# EasyEDA Pro project C8T6v1.eprj, board PCB5
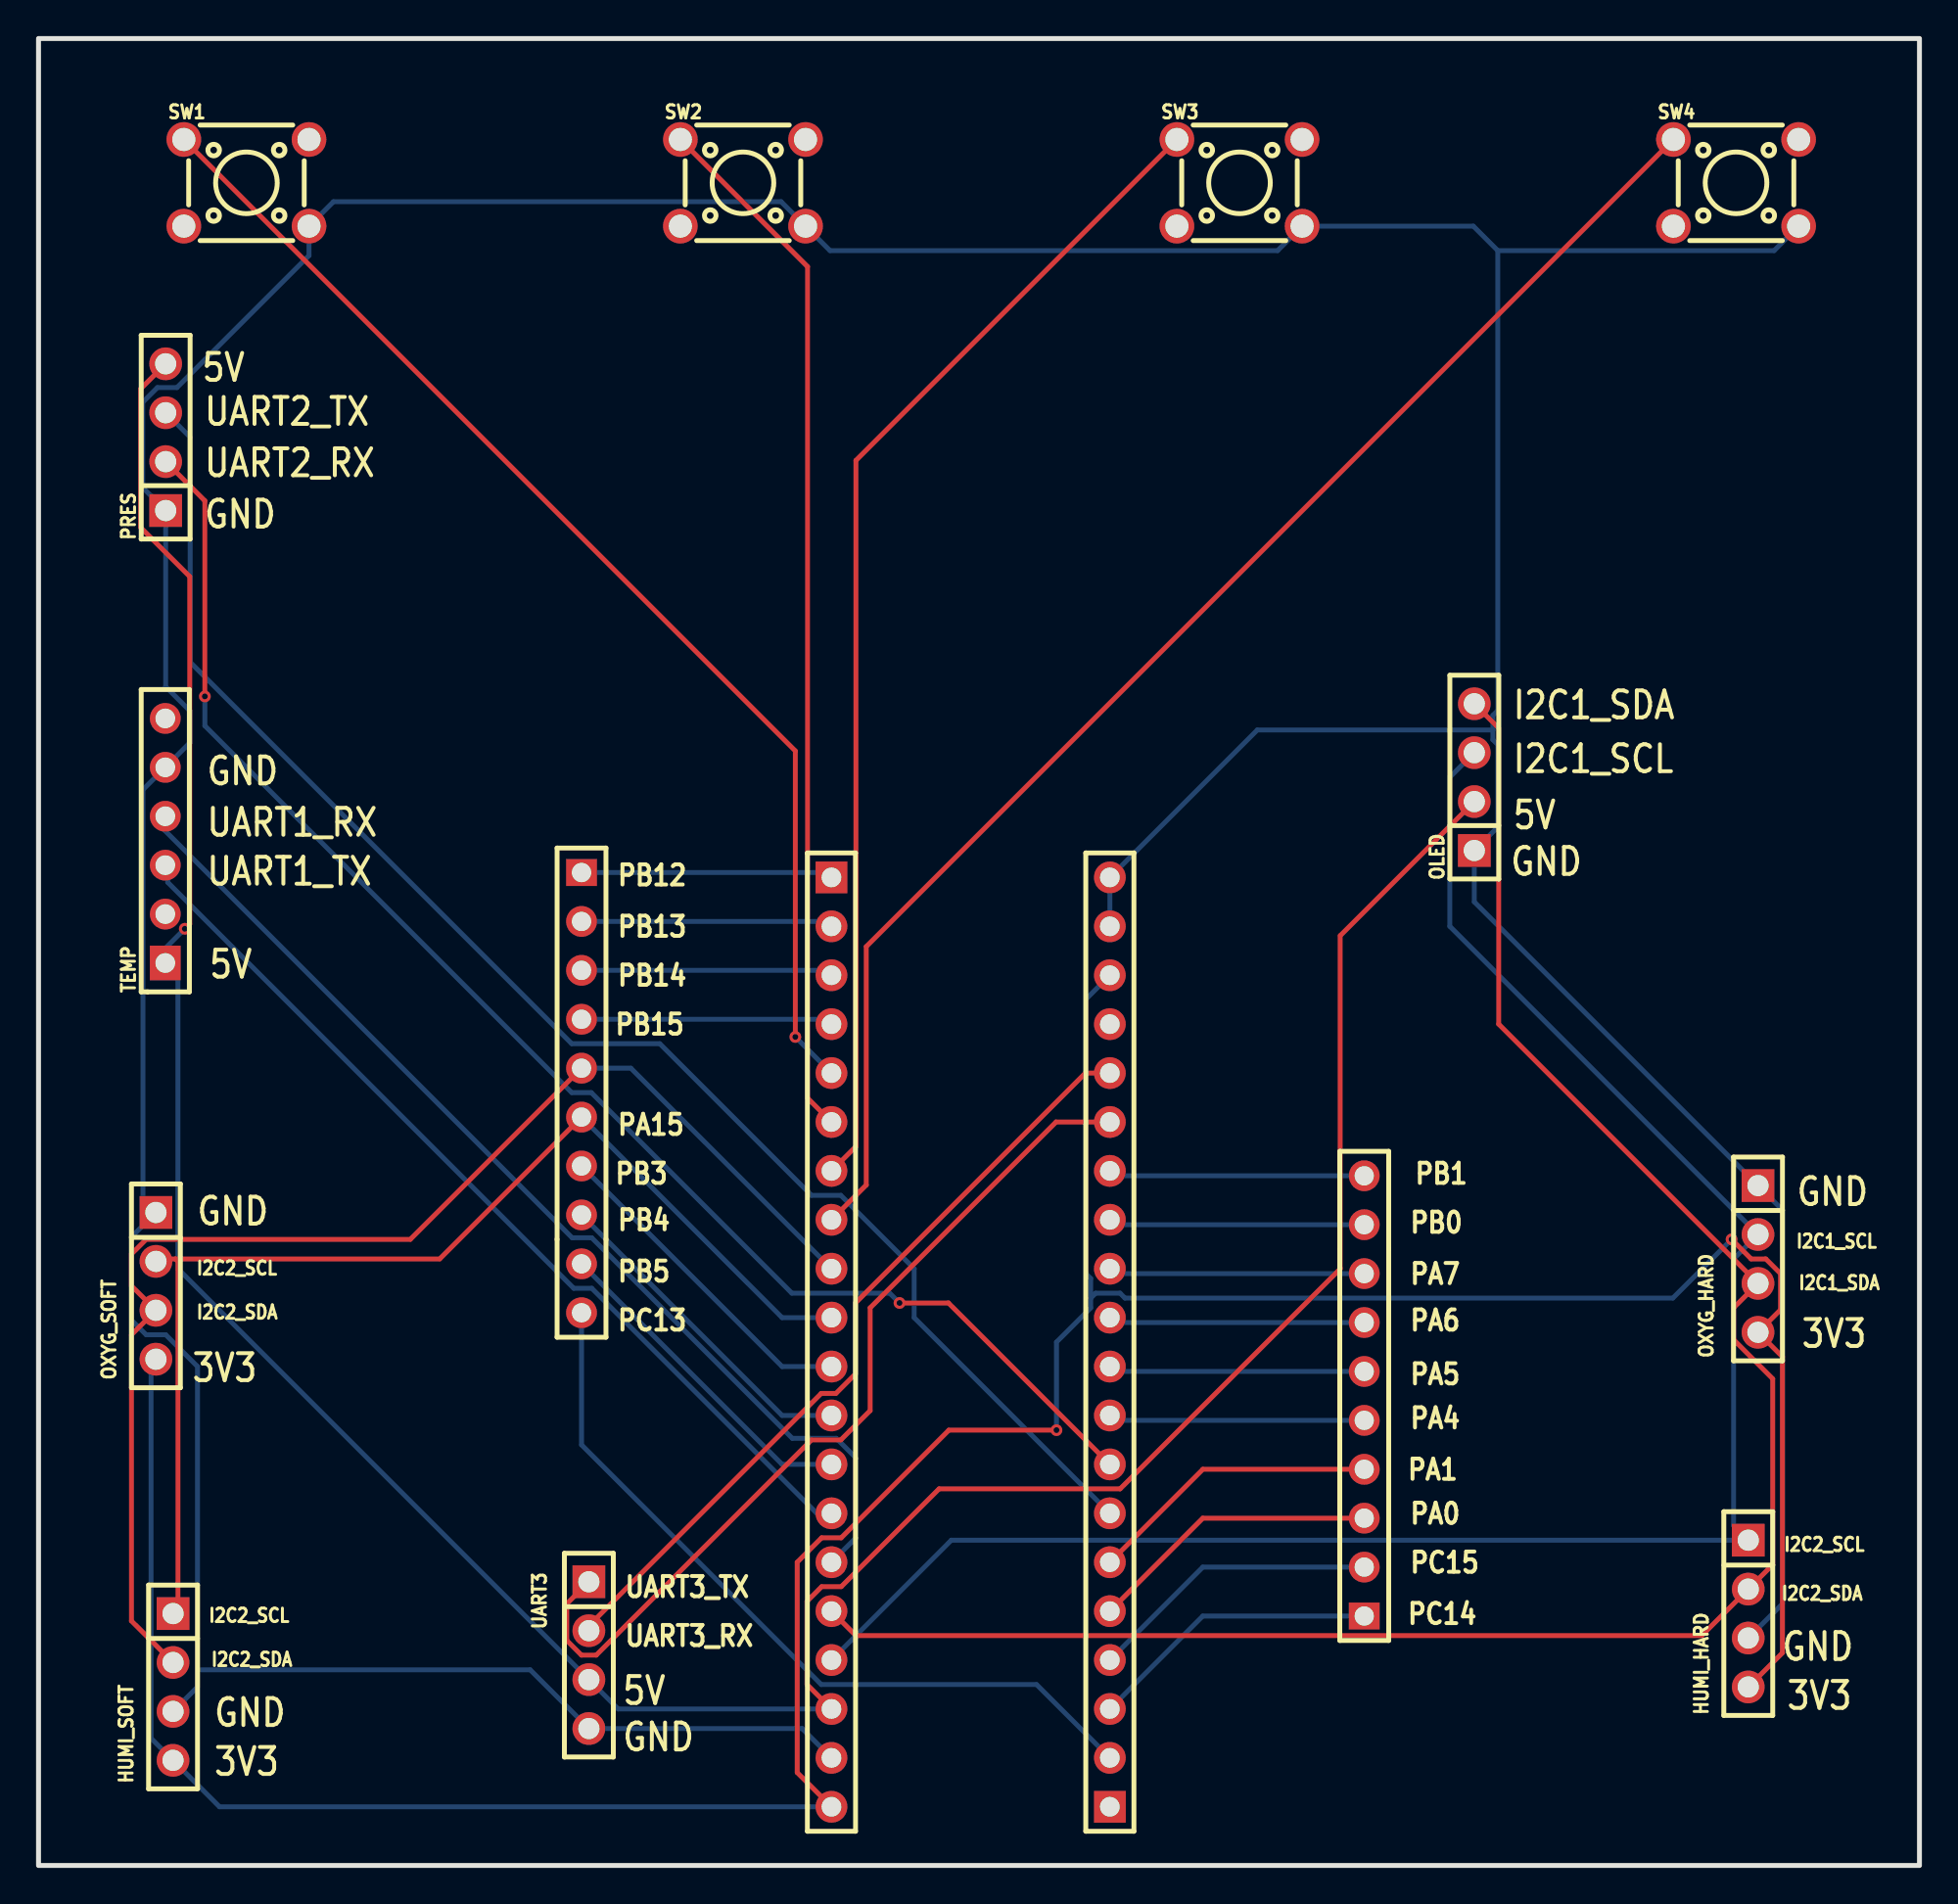
[diagram p10: board, top side]
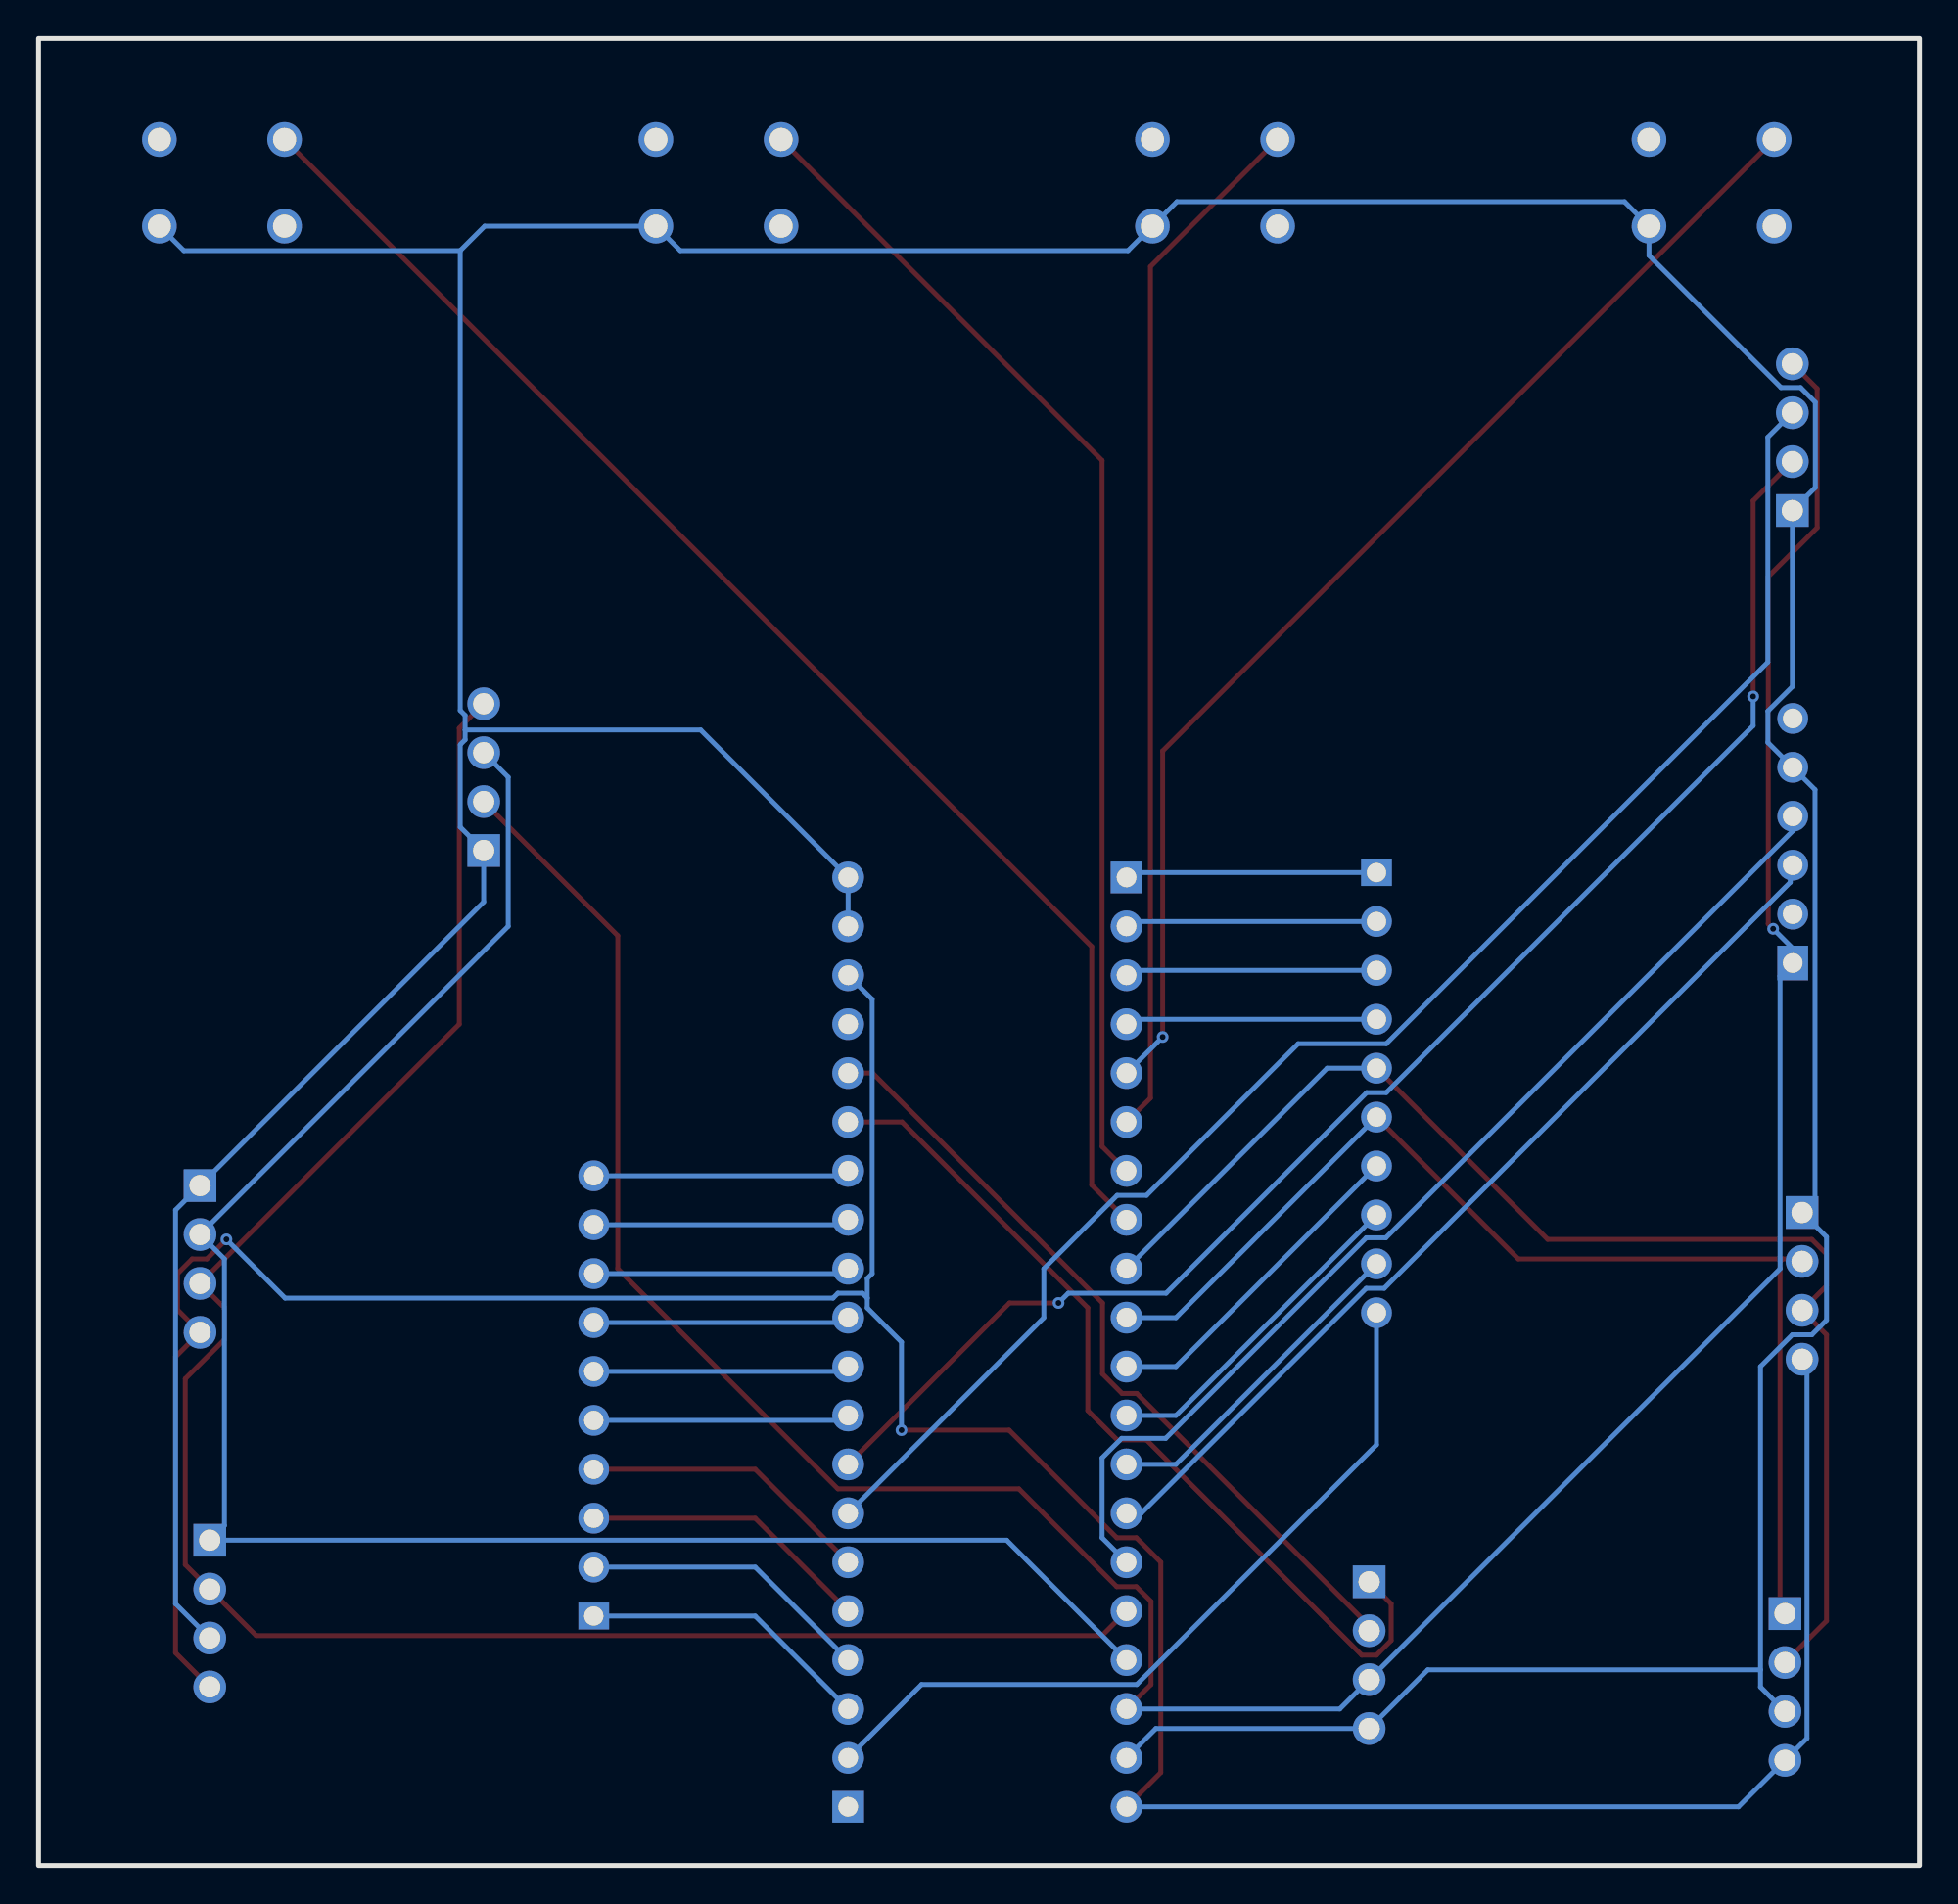
[diagram p11: board, bottom side, seen from below]

Outline 97.66 x 94.87 mm; copper layers: Top Layer, Bottom Layer. Coordinates in mm from the lower left corner of the outline.
Outline path: rectangle 0,94.87 97.66,0
Stack: Top Layer 0.035mm / Dielectric1 1.51mm FR4 er 4.5 / Bottom Layer 0.035mm

## Design rules (mm)
template: JLCPCB Capability(Two Layers Board)
spacing copperThickness1oz (default): track to track 0.102, other pairs 0.152 to 0.3
spacing copperThickness2oz: track to track 0.203, other pairs 0.152 to 0.3
track width copperThickness1oz (default): min 0.127, default 0.254, max 2.54
track width copperThickness2oz: min 0.203, default 0.254, max 2.54
differential pair differentialPair (default): width min 0.127, default 0.254, max 2.54; gap min 0.152, default 0.152
via viaSize (default): diameter min 0.5, default 0.61, max 10; hole min 0.3, default 0.305, max 6.3

## Placement (name value [footprint] x y rotation side)
H1  LAIL-PZ2.54-10P-L  [CONN-TH_LAIL-PZ2.54-10P-L]  28.19 40.13 270 top
H2  LAIL-PZ2.54-10P-L  [CONN-TH_LAIL-PZ2.54-10P-L]  68.83 24.38 90 top
HUMI_HARD  LAIL-PM2.54-4P-L  [HDR-TH_4P-P2.54-V-F]  88.77 13.08 270 top
HUMI_SOFT  LAIL-PM2.54-4P-L  [HDR-TH_4P-P2.54-V-F]  6.98 9.27 270 top
OLED  LAIL-PM2.54-4P-L  [HDR-TH_4P-P2.54-V-F]  74.55 56.52 90 top
OXYG_HARD  LAIL-PM2.54-4P-L  [HDR-TH_4P-P2.54-V-F]  89.28 31.5 270 top
OXYG_SOFT  LAIL-PM2.54-4P-L  [HDR-TH_4P-P2.54-V-F]  6.1 30.1 270 top
PRES  LAIL-PM2.54-4P-L  [HDR-TH_4P-P2.54-V-F]  6.6 74.17 90 top
SW1  TS665CJ  [SW-TH_4P-L6.0-W6.0-P4.50-LS6.5]  10.8 87.38 0 top
SW2  TS665CJ  [SW-TH_4P-L6.0-W6.0-P4.50-LS6.5]  36.58 87.38 0 top
SW3  TS665CJ  [SW-TH_4P-L6.0-W6.0-P4.50-LS6.5]  62.36 87.38 0 top
SW4  TS665CJ  [SW-TH_4P-L6.0-W6.0-P4.50-LS6.5]  88.14 87.38 0 top
TEMP  LAIL-PM2.54-6P-L  [HDR-TH_LAIL-PM2.54-6P-L]  6.58 53.21 90 top
U1  KH-2.54FH-1X20P-H8.5  [HDR-TH_20P-P2.54-V-F-2]  41.17 27.18 270 top
U2  KH-2.54FH-1X20P-H8.5  [HDR-TH_20P-P2.54-V-F-2]  55.63 27.18 90 top
UART3  LAIL-PM2.54-4P-L  [HDR-TH_4P-P2.54-V-F]  28.58 10.92 270 top

## Footprints (pads in the part's own frame, mm; a bottom-side part is the same pattern mirrored in y, then rotated)
CONN-TH_LAIL-PZ2.54-10P-L
  rect 1.4x1.6 hole 1: 1(-11.43,0)
  round 1.6 hole 1: 2(-8.89,0) 3(-6.35,0) 4(-3.81,0) 5(-1.27,0) 6(1.27,0) 7(3.81,0) 8(6.35,0) 9(8.89,0) 10(11.43,0)
HDR-TH_4P-P2.54-V-F
  rect 1.7x1.7 hole 1.1: 1(-3.81,0)
  round 1.7 hole 1.1: 2(-1.27,0) 3(1.27,0) 4(3.81,0)
HDR-TH_20P-P2.54-V-F-2
  rect 1.65x1.65 hole 1.02: 1(-24.13,0)
  round 1.65 hole 1.02: 2(-21.59,0) 3(-19.05,0) 4(-16.51,0) 5(-13.97,0) 6(-11.43,0) 7(-8.89,0) 8(-6.35,0) 9(-3.81,0) 10(-1.27,0) 11(1.27,0) 12(3.81,0) 13(6.35,0) 14(8.89,0) 15(11.43,0) 16(13.97,0) 17(16.51,0) 18(19.05,0) 19(21.59,0) 20(24.13,0)
HDR-TH_LAIL-PM2.54-6P-L
  rect 1.8x1.6 hole 1.02: 1(-6.35,0)
  round 1.6 hole 1.02: 2(-3.81,0) 3(-1.27,0) 4(1.27,0) 5(3.81,0) 6(6.35,0)
SW-TH_4P-L6.0-W6.0-P4.50-LS6.5
  round 1.8 hole 1.2: 1(-3.25,2.25) 2(3.25,2.25) 3(-3.25,-2.25) 4(3.25,-2.25)

## Nets
3V3: HUMI_HARD.4 HUMI_SOFT.4 OXYG_HARD.4 OXYG_SOFT.4 U1.20 U2.18
3V3_TEMP: TEMP.2
5V: OLED.2 PRES.4 TEMP.1 U1.18 UART3.3
GND: HUMI_HARD.3 HUMI_SOFT.3 OLED.1 OXYG_HARD.1 OXYG_SOFT.1 PRES.1 SW1.4 SW2.4 SW3.4 SW4.4 TEMP.5 U1.19 U2.19 U2.20 UART3.4
EMP: TEMP.6
I2C1_SCL: HUMI_HARD.1 OLED.3 OXYG_HARD.2 U1.17
I2C1_SDA: HUMI_HARD.2 OLED.4 OXYG_HARD.3 U1.16
I2C2_SCL: H1.6 HUMI_SOFT.1 OXYG_SOFT.2 U1.10
I2C2_SDA: H1.5 HUMI_SOFT.2 OXYG_SOFT.3 U1.9
PA0: H2.3 U2.5
PA1: H2.4 U2.6
PA2: PRES.3 U2.7
PA3: PRES.2 U2.8
PA4: H2.5 U2.9
PA5: H2.6 U2.10
PA6: H2.7 U2.11
PA7: H2.8 U2.12
PA8: SW1.1 U1.5
PA9: SW2.1 U1.6
PA10: SW3.1 U1.7
PA11: SW4.1 U1.8
PB0: H2.9 U2.13
PB1: H2.10 U2.14
PB3: H1.7 U1.11
PB4: H1.8 U1.12
PB5: H1.9 U1.13
PB6: TEMP.3 U1.14
PB7: TEMP.4 U1.15
PB10: U2.15 UART3.1
PB11: U2.16 UART3.2
PB12: H1.1 U1.1
PB13: H1.2 U1.2
PB14: H1.3 U1.3
PB15: H1.4 U1.4
PC13: H1.10 U2.2
PC14: H2.1 U2.3
PC15: H2.2 U2.4
RES: U2.17
VBT: U2.1

Pads without a net: SW1 2 3; SW2 2 3; SW3 2 3; SW4 2 3

## Via types
v1: diameter 0.61, hole 0.305, Top Layer to Bottom Layer, 6 vias

## Routing (per net, layer and track width the routed paths; a pad name or vN(x,y) marks a point on that pad's centre or on a via; arc(x,y) is an arc through that point)
3V3: length 172.5
  Top Layer w0.254: HUMI_HARD.4 90.55,11.05 90.55,26.42 OXYG_HARD.4 90.45,28.85 90.45,30.73 89.69,31.5 88.92,31.5 v1(87.91,32.51) ; v1(52.85,22.61) 47.27,22.61 41.68,17.02 40.66,17.02 39.39,15.75 39.39,4.83 U1.20
  Bottom Layer w0.254: U2.18 54.38,44.98 54.38,30.73 54.63,30.48 54.63,29.46 ; 54.63,29.46 54.63,28.96 52.85,27.18 v1(52.85,22.61) ; 54.63,29.46 54.89,29.72 56.16,29.72 56.41,29.46 84.86,29.46 v1(87.91,32.51) ; U1.20 9.4,3.05 HUMI_SOFT.4 5.84,6.6 5.84,26.04 OXYG_SOFT.4
5V: length 160.9
  Top Layer w0.254: PRES.4 5.31,76.69 5.31,69.47 7.85,66.93 7.85,48.9 v1(7.6,48.64) ; OLED.2 67.59,48.28 67.59,30.99 56.16,19.56 46.76,19.56 41.68,14.48 40.66,14.48 39.9,13.72 39.9,9.4 U1.18
  Bottom Layer w0.254: U1.18 30.1,8.13 UART3.3 7.24,30.99 7.24,46.21 TEMP.1 6.58,47.63 v1(7.6,48.64)
GND: length 307.7
  Bottom Layer w0.254: 75.77,83.86 75.77,59.98 75.51,59.73 75.51,58.96 ; 75.77,83.86 74.5,85.13 SW3.4 64.34,83.86 41.1,83.86 SW2.4 38.56,86.4 15.31,86.4 SW1.4 14.05,83.6 7.19,76.74 6.17,76.74 5.41,75.98 5.41,71.55 PRES.1 6.6,61.21 7.87,59.94 7.87,58.31 TEMP.5 5.42,55.87 5.42,34.58 OXYG_SOFT.1 4.83,32.64 4.83,28.32 5.59,27.56 6.6,27.56 8.25,25.91 8.25,10.16 ; 75.77,83.86 90.12,83.86 SW4.4 ; HUMI_SOFT.3 8.25,9.27 8.25,10.16 ; 75.51,58.96 63.28,58.96 U2.20 U2.19 ; 75.51,58.96 75.51,58.46 75.77,58.2 75.77,53.92 OLED.1 74.55,50.04 OXYG_HARD.1 90.55,34.04 90.55,13.59 HUMI_HARD.3 ; 8.25,10.16 25.53,10.16 UART3.4 39.65,7.11 U1.19
I2C1_SCL: length 99.1
  Bottom Layer w0.254: U1.17 47.39,16.89 HUMI_HARD.1 88.01,17.65 88.01,31.5 OXYG_HARD.2 73.28,48.77 73.28,56.51 OLED.3
I2C1_SDA: length 103.1
  Top Layer w0.254: U1.16 42.44,11.94 86.36,11.94 HUMI_HARD.2 90.04,15.62 90.04,25.27 88.01,27.31 88.01,28.96 OXYG_HARD.3 75.82,43.69 75.82,59.06 OLED.4
I2C2_SCL: length 61.1
  Top Layer w0.254: OXYG_SOFT.2 6.22,31.5 7.11,31.5 ; H1.6 20.83,31.5 7.11,31.5 ; 7.11,31.5 7.24,31.37 7.24,13.34 HUMI_SOFT.1
  Bottom Layer w0.254: U1.10 38.61,28.45 H1.6
I2C2_SDA: length 67.8
  Top Layer w0.254: HUMI_SOFT.2 4.83,12.7 4.83,27.56 OXYG_SOFT.3 4.83,30.1 4.83,31.75 5.59,32.51 19.3,32.51 28.19,41.4
  Bottom Layer w0.254: 28.19,41.4 30.76,41.4 U1.9
PA0: length 15.2
  Top Layer w0.254: U2.5 60.45,18.03 H2.3
PA1: length 15.2
  Top Layer w0.254: U2.6 60.45,20.57 H2.4
PA2: length 81
  Bottom Layer w0.254: PRES.3 7.87,74.17 7.87,62.48 27.69,42.67 32.26,42.67 40.13,34.8 41.66,34.8 45.47,30.99 45.47,28.45 U2.7
PA3: length 77.4
  Top Layer w0.254: PRES.2 8.64,70.86 v1(8.64,60.71) ; U2.8 47.24,29.21 v1(44.7,29.21)
  Bottom Layer w0.254: v1(8.64,60.71) 8.64,59.18 27.69,40.13 28.7,40.13 39.12,29.72 44.2,29.72 v1(44.7,29.21)
PA4: length 13.3
  Bottom Layer w0.254: 55.63,23.37 55.88,23.11 H2.5
PA5: length 13.3
  Bottom Layer w0.254: U2.10 55.88,25.65 H2.6
PA6: length 13.3
  Bottom Layer w0.254: H2.7 55.88,28.19 U2.11
PA7: length 13.3
  Bottom Layer w0.254: U2.12 55.88,30.73 H2.8
PA8: length 62.4
  Top Layer w0.254: 7.55,89.63 39.29,57.88 v1(39.29,43.02)
  Bottom Layer w0.254: v1(39.29,43.02) U1.5
PA9: length 54.3
  Top Layer w0.254: 33.33,89.63 39.93,83.02 39.93,39.85 U1.6
PA10: length 61
  Top Layer w0.254: 59.11,89.63 42.44,72.96 42.44,37.34 U1.7
PA11: length 74.2
  Top Layer w0.254: U1.8 42.98,35.34 42.98,47.72 84.89,89.63
PB0: length 13.3
  Bottom Layer w0.254: H2.9 55.88,33.27 U2.13
PB1: length 13.3
  Bottom Layer w0.254: U2.14 55.88,35.81 H2.10
PB3: length 17.3
  Bottom Layer w0.254: H1.7 38.61,25.91 U1.11
PB4: length 17.3
  Bottom Layer w0.254: 41.17,23.37 38.61,23.37 H1.8
PB5: length 17.3
  Bottom Layer w0.254: H1.9 38.61,20.83 U1.13
PB6: length 49
  Bottom Layer w0.254: TEMP.3 6.71,51.82 6.71,51.05 27.79,29.97 28.72,29.97 40.41,18.29 U1.14
PB7: length 56
  Bottom Layer w0.254: U1.15 42.44,17.02 42.44,21.16 41.43,22.18 39.14,22.18 28.72,32.59 27.71,32.59 6.58,53.72 TEMP.4
PB10: length 46.6
  Top Layer w0.254: UART3.1 27.43,13.59 27.43,11.68 28.19,10.92 28.96,10.92 40.13,22.1 41.66,22.1 43.18,23.62 43.18,28.96 52.83,38.61 U2.15
PB11: length 41.4
  Top Layer w0.254: UART3.2 28.7,12.32 28.7,12.57 40.64,24.51 41.4,24.51 42.42,25.53 42.42,29.21 54.36,41.15 U2.16
PB12: length 13.1
  Bottom Layer w0.254: H1.1 40.92,51.56 U1.1
PB13: length 13.1
  Bottom Layer w0.254: H1.2 40.92,49.02 U1.2
PB14: length 13.1
  Bottom Layer w0.254: 28.19,46.48 40.92,46.48 U1.3
PB15: length 13.1
  Bottom Layer w0.254: H1.4 40.92,43.94 41.17,43.69
PC13: length 41
  Bottom Layer w0.254: U2.2 51.82,9.4 40.64,9.4 28.19,21.84 28.19,28.7
PC14: length 15.2
  Bottom Layer w0.254: U2.3 60.45,12.95 H2.1
PC15: length 15.2
  Bottom Layer w0.254: U2.4 60.45,15.49 H2.2

## Text on the board
Top Silkscreen Layer: I2C2_SCL | I2C2_SDA | I2C1_SCL | I2C1_SDA | PB15 | PB3 | PB12 | PB13 | PB14 | PA15 | PB4 | PB5 | PC13 | UART3_TX | UART3_RX | PA1 | PC14 | PB0 | PA7 | PA6 | PA5 | PA4 | PA0 | PC15 | PB1 | 3V3 | GND | 5V | UART2_TX | UART2_RX | UART1_RX | UART1_TX
